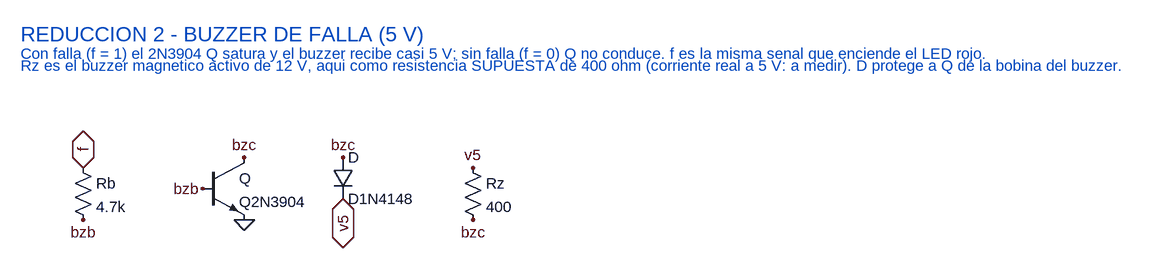
[diagram p0: schematic BLOQUE_BUZZER.asc]
BLOQUE_BUZZER.asc, the LTspice schematic file:
Version 4
SHEET 1 1000 400
FLAG 16 16 f
FLAG 16 96 bzb
FLAG 200 48 bzb
FLAG 264 0 bzc
FLAG 264 96 0
FLAG 416 0 bzc
FLAG 416 64 v5
FLAG 616 16 v5
FLAG 616 96 bzc
IOPIN 16 16 BiDir
IOPIN 416 64 BiDir
SYMBOL res 0 0 R0
SYMATTR InstName Rb
SYMATTR Value 4.7k
SYMBOL npn 200 0 R0
SYMATTR InstName Q
SYMATTR Value Q2N3904
SYMBOL diode 400 0 R0
SYMATTR InstName D
SYMATTR Value D1N4148
SYMBOL res 600 0 R0
SYMATTR InstName Rz
SYMATTR Value 400
TEXT -80 -190 Left 3 ;REDUCCION 2 - BUZZER DE FALLA (5 V)
TEXT -80 -160 Left 2 ;Con falla (f = 1) el 2N3904 Q satura y el buzzer recibe casi 5 V; sin falla (f = 0) Q no conduce. f es la misma senal que enciende el LED rojo.
TEXT -80 -142 Left 2 ;Rz es el buzzer magnetico activo de 12 V, aqui como resistencia SUPUESTA de 400 ohm (corriente real a 5 V: a medir). D protege a Q de la bobina del buzzer.

The netlist it stands for:
* BLOQUE_BUZZER.asc
Rb f bzb 4.7k
Q bzc bzb 0 0 Q2N3904
D bzc v5 D1N4148
Rz v5 bzc 400
.model D D
.lib standard.dio
.model NPN NPN
.model PNP PNP
.lib standard.bjt
* REDUCCION 2 - BUZZER DE FALLA (5 V)
* Con falla (f = 1) el 2N3904 Q satura y el buzzer recibe casi 5 V; sin falla (f = 0) Q no conduce. f es la misma senal que enciende el LED rojo.
* Rz es el buzzer magnetico activo de 12 V, aqui como resistencia SUPUESTA de 400 ohm (corriente real a 5 V: a medir). D protege a Q de la bobina del buzzer.
.backanno
.end